# Altium schematic sheet Ext_Stepper_Driver_Sheet.SchDoc
size 420 x 297 mm; DocumentNumber: 8; SheetNumber: 8
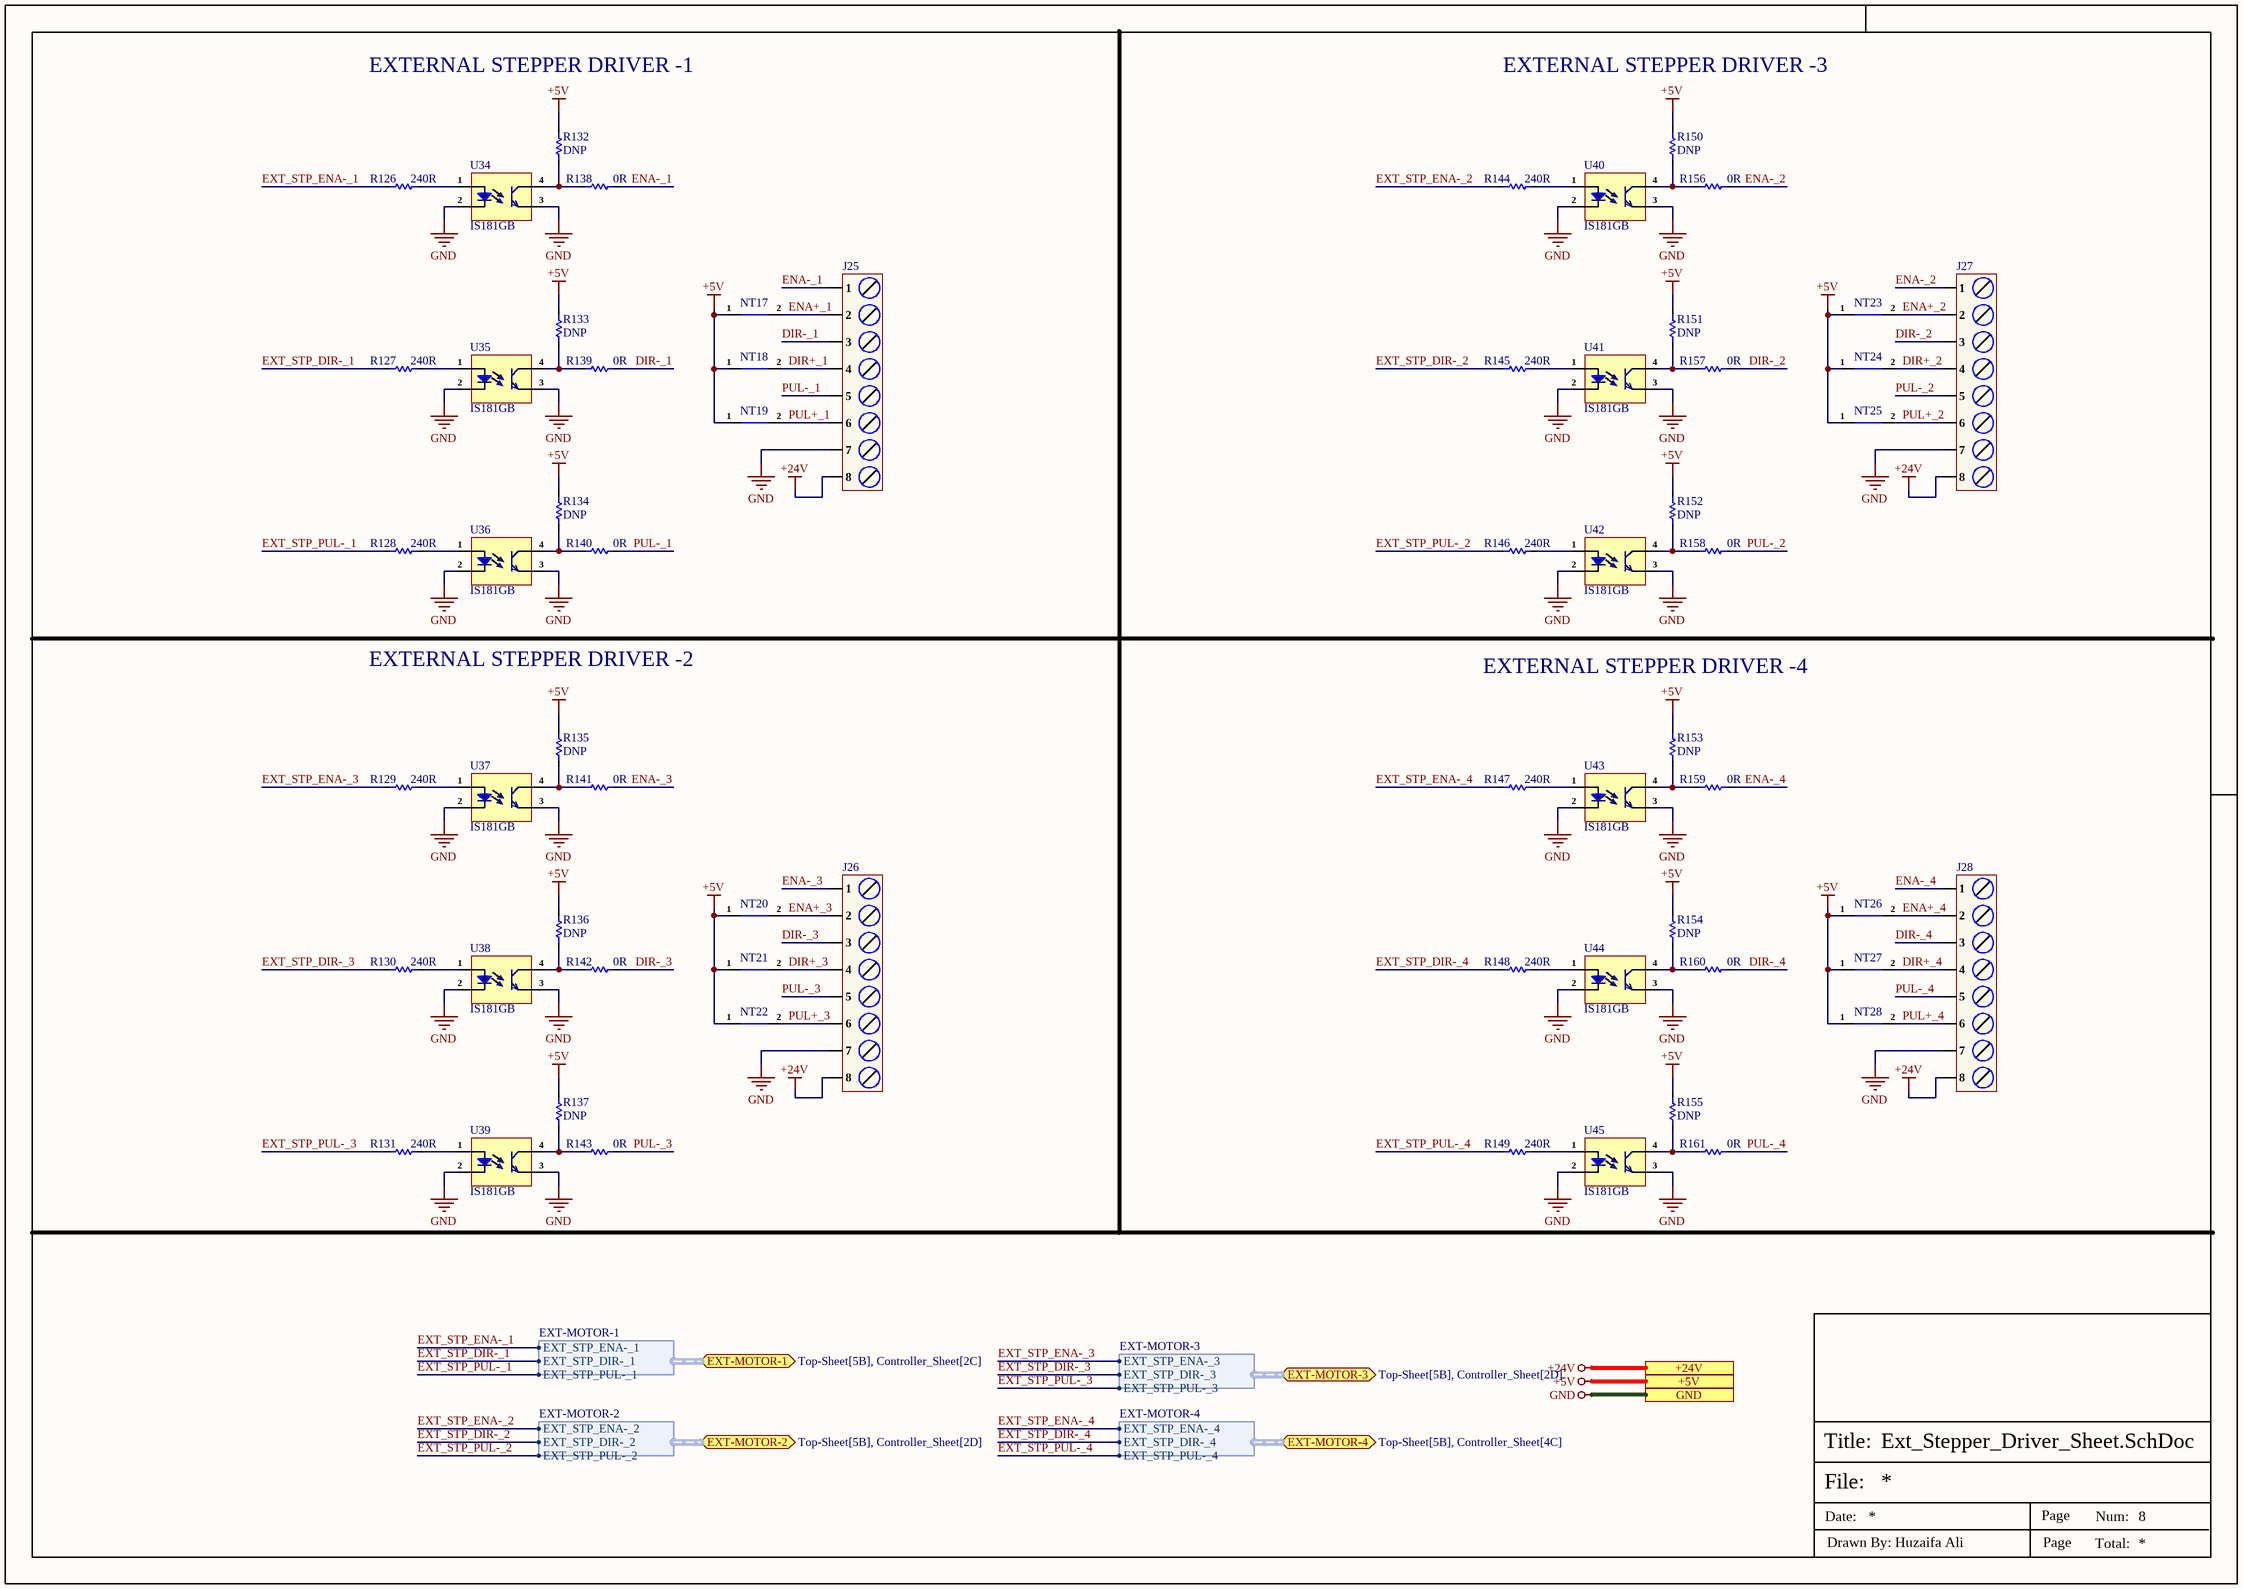
[diagram p0: Ext_Stepper_Driver_Sheet.SchDoc]

## Parts
J25  DB125-3.81-8P-GN-S  [DB125-3.81-8P-GN-S]  (value not drawn)
J26  DB125-3.81-8P-GN-S  [DB125-3.81-8P-GN-S]  (value not drawn)
J27  DB125-3.81-8P-GN-S  [DB125-3.81-8P-GN-S]  (value not drawn)
J28  DB125-3.81-8P-GN-S  [DB125-3.81-8P-GN-S]  (value not drawn)
NT17  Net Tie_SMD  [Net Tie Pad]  (value not drawn)  (net tie, no BOM)
NT18  Net Tie_SMD  [Net Tie Pad]  (value not drawn)  (net tie, no BOM)
NT19  Net Tie_SMD  [Net Tie Pad]  (value not drawn)  (net tie, no BOM)
NT20  Net Tie_SMD  [Net Tie Pad]  (value not drawn)  (net tie, no BOM)
NT21  Net Tie_SMD  [Net Tie Pad]  (value not drawn)  (net tie, no BOM)
NT22  Net Tie_SMD  [Net Tie Pad]  (value not drawn)  (net tie, no BOM)
NT23  Net Tie_SMD  [Net Tie Pad]  (value not drawn)  (net tie, no BOM)
NT24  Net Tie_SMD  [Net Tie Pad]  (value not drawn)  (net tie, no BOM)
NT25  Net Tie_SMD  [Net Tie Pad]  (value not drawn)  (net tie, no BOM)
NT26  Net Tie_SMD  [Net Tie Pad]  (value not drawn)  (net tie, no BOM)
NT27  Net Tie_SMD  [Net Tie Pad]  (value not drawn)  (net tie, no BOM)
NT28  Net Tie_SMD  [Net Tie Pad]  (value not drawn)  (net tie, no BOM)
R126  240R  [Res-0402]
R127  240R  [Res-0402]
R128  240R  [Res-0402]
R129  240R  [Res-0402]
R130  240R  [Res-0402]
R131  240R  [Res-0402]
R132  DNP  [Res-0402]
R133  DNP  [Res-0402]
R134  DNP  [Res-0402]
R135  DNP  [Res-0402]
R136  DNP  [Res-0402]
R137  DNP  [Res-0402]
R138  0R  [Res-0402]
R139  0R  [Res-0402]
R140  0R  [Res-0402]
R141  0R  [Res-0402]
R142  0R  [Res-0402]
R143  0R  [Res-0402]
R144  240R  [Res-0402]
R145  240R  [Res-0402]
R146  240R  [Res-0402]
R147  240R  [Res-0402]
R148  240R  [Res-0402]
R149  240R  [Res-0402]
R150  DNP  [Res-0402]
R151  DNP  [Res-0402]
R152  DNP  [Res-0402]
R153  DNP  [Res-0402]
R154  DNP  [Res-0402]
R155  DNP  [Res-0402]
R156  0R  [Res-0402]
R157  0R  [Res-0402]
R158  0R  [Res-0402]
R159  0R  [Res-0402]
R160  0R  [Res-0402]
R161  0R  [Res-0402]
U34  IS181GB  [SOP-4_2.54]
U35  IS181GB  [SOP-4_2.54]
U36  IS181GB  [SOP-4_2.54]
U37  IS181GB  [SOP-4_2.54]
U38  IS181GB  [SOP-4_2.54]
U39  IS181GB  [SOP-4_2.54]
U40  IS181GB  [SOP-4_2.54]
U41  IS181GB  [SOP-4_2.54]
U42  IS181GB  [SOP-4_2.54]
U43  IS181GB  [SOP-4_2.54]
U44  IS181GB  [SOP-4_2.54]
U45  IS181GB  [SOP-4_2.54]

## Ports
+5V (see Top-Sheet[5B], CAN_Sheet[5D], Controller_Sheet[5D], Power_Sheet[5D]), +24V (see Top-Sheet[5B], Power_Sheet[5D], Stepper_Driver_Sheet[5D]), EXT-MOTOR-1 (bidir, harness EXT-MOTOR-1, see Top-Sheet[5B], Controller_Sheet[2C]), EXT-MOTOR-2 (bidir, harness EXT-MOTOR-2, see Top-Sheet[5B], Controller_Sheet[2D]), EXT-MOTOR-3 (bidir, harness EXT-MOTOR-3, see Top-Sheet[5B], Controller_Sheet[2D]), EXT-MOTOR-4 (bidir, harness EXT-MOTOR-4, see Top-Sheet[5B], Controller_Sheet[4C]), GND (see Top-Sheet[5B], CAN_Sheet[5D], Controller_Sheet[5D], EtherCAT_Sheet[5D], Power_Sheet[5D], RS485_RS232_Sheet[2D], Stepper_Driver_Sheet[5D])

## Harnesses
EXT-MOTOR-1: EXT_STP_ENA-_1, EXT_STP_DIR-_1, EXT_STP_PUL-_1
EXT-MOTOR-2: EXT_STP_ENA-_2, EXT_STP_DIR-_2, EXT_STP_PUL-_2
EXT-MOTOR-3: EXT_STP_ENA-_3, EXT_STP_DIR-_3, EXT_STP_PUL-_3
EXT-MOTOR-4: EXT_STP_ENA-_4, EXT_STP_DIR-_4, EXT_STP_PUL-_4

## Nets
+5V: NT17.1 NT18.1 NT19.1 NT20.1 NT21.1 NT22.1 NT23.1 NT24.1 NT25.1 NT26.1 NT27.1 NT28.1 R132.2 R133.2 R134.2 R135.2 R136.2 R137.2 R150.2 R151.2 R152.2 R153.2 R154.2 R155.2 ; port +5V
+24V: J25.8 J26.8 J27.8 J28.8 ; port +24V
GND: J25.7 J26.7 J27.7 J28.7 U34.2(Ca) U34.3(E) U35.2(Ca) U35.3(E) U36.2(Ca) U36.3(E) U37.2(Ca) U37.3(E) U38.2(Ca) U38.3(E) U39.2(Ca) U39.3(E) U40.2(Ca) U40.3(E) U41.2(Ca) U41.3(E) U42.2(Ca) U42.3(E) U43.2(Ca) U43.3(E) U44.2(Ca) U44.3(E) U45.2(Ca) U45.3(E) ; port GND
DIR+_1: J25.4 NT18.2
DIR+_2: J27.4 NT24.2
DIR+_3: J26.4 NT21.2
DIR+_4: J28.4 NT27.2
DIR-_1: J25.3 R139.2
DIR-_2: J27.3 R157.2
DIR-_3: J26.3 R142.2
DIR-_4: J28.3 R160.2
ENA+_1: J25.2 NT17.2
ENA+_2: J27.2 NT23.2
ENA+_3: J26.2 NT20.2
ENA+_4: J28.2 NT26.2
ENA-_1: J25.1 R138.2
ENA-_2: J27.1 R156.2
ENA-_3: J26.1 R141.2
ENA-_4: J28.1 R159.2
EXT_STP_DIR-_1: R127.1 ; port EXT-MOTOR-1.EXT_STP_DIR-_1
EXT_STP_DIR-_2: R145.1 ; port EXT-MOTOR-2.EXT_STP_DIR-_2
EXT_STP_DIR-_3: R130.1 ; port EXT-MOTOR-3.EXT_STP_DIR-_3
EXT_STP_DIR-_4: R148.1 ; port EXT-MOTOR-4.EXT_STP_DIR-_4
EXT_STP_ENA-_1: R126.1 ; port EXT-MOTOR-1.EXT_STP_ENA-_1
EXT_STP_ENA-_2: R144.1 ; port EXT-MOTOR-2.EXT_STP_ENA-_2
EXT_STP_ENA-_3: R129.1 ; port EXT-MOTOR-3.EXT_STP_ENA-_3
EXT_STP_ENA-_4: R147.1 ; port EXT-MOTOR-4.EXT_STP_ENA-_4
EXT_STP_PUL-_1: R128.1 ; port EXT-MOTOR-1.EXT_STP_PUL-_1
EXT_STP_PUL-_2: R146.1 ; port EXT-MOTOR-2.EXT_STP_PUL-_2
EXT_STP_PUL-_3: R131.1 ; port EXT-MOTOR-3.EXT_STP_PUL-_3
EXT_STP_PUL-_4: R149.1 ; port EXT-MOTOR-4.EXT_STP_PUL-_4
PUL+_1: J25.6 NT19.2
PUL+_2: J27.6 NT25.2
PUL+_3: J26.6 NT22.2
PUL+_4: J28.6 NT28.2
PUL-_1: J25.5 R140.2
PUL-_2: J27.5 R158.2
PUL-_3: J26.5 R143.2
PUL-_4: J28.5 R161.2
NetR126_2: R126.2 U34.1(An)
NetR127_2: R127.2 U35.1(An)
NetR128_2: R128.2 U36.1(An)
NetR129_2: R129.2 U37.1(An)
NetR130_2: R130.2 U38.1(An)
NetR131_2: R131.2 U39.1(An)
NetR132_1: R132.1 R138.1 U34.4(C)
NetR133_1: R133.1 R139.1 U35.4(C)
NetR134_1: R134.1 R140.1 U36.4(C)
NetR135_1: R135.1 R141.1 U37.4(C)
NetR136_1: R136.1 R142.1 U38.4(C)
NetR137_1: R137.1 R143.1 U39.4(C)
NetR144_2: R144.2 U40.1(An)
NetR145_2: R145.2 U41.1(An)
NetR146_2: R146.2 U42.1(An)
NetR147_2: R147.2 U43.1(An)
NetR148_2: R148.2 U44.1(An)
NetR149_2: R149.2 U45.1(An)
NetR150_1: R150.1 R156.1 U40.4(C)
NetR151_1: R151.1 R157.1 U41.4(C)
NetR152_1: R152.1 R158.1 U42.4(C)
NetR153_1: R153.1 R159.1 U43.4(C)
NetR154_1: R154.1 R160.1 U44.4(C)
NetR155_1: R155.1 R161.1 U45.4(C)

## Notes on the sheet
- EXTERNAL STEPPER DRIVER -1
- EXTERNAL STEPPER DRIVER -3
- EXTERNAL STEPPER DRIVER -2
- EXTERNAL STEPPER DRIVER -4
- File:
- Title:
- Date:
- Page
- Num:
- Total:
- Drawn By: Huzaifa Ali

## Library data of the parts
J25-J28 = DB125-3.81-8P-GN-S: Plugin,P=3.81mm Screw Terminal Blocks ROHS; Manufacturer: DORABO; Manufacturer Part Number: DB125-3.81-8P-GN-S; Package: Plugin,P=3.81mm; LCSC Part Number: C5143698; Item Type: Terminal Block; ComponentLink1Description: LCSC; ComponentLink1URL: https://www.lcsc.com/product-detail/Screw-Terminal-Blocks_DORABO-DB125-3-81-8P-GN-S_C5143698.html
NT17-NT28 = Net Tie_SMD: Net Tie SMD; Manufacturer Part Number: Net Tie; Item Type: Net Tie Pad
R126-R131 R144-R149 = RC0402FR-07240RL: RES 240 OHM 1% 1/16W 0402; Manufacturer: Yageo; Item Type: Resistors; Power Rating: 63mW; Temperature Coefficient: 100ppm/°C; Voltage Rating (DC): 50V; Supplier 1: Mouser; Manufacturer Part Number: RC0402FR-07240RL; RoHS: Yes; Stock 1: 1903202; Pricing 1: 1=0.10000, 10=0.01200, 50=0.01200, 100=0.00500, 1000=0.00300, 10000=0.00100 (USD); Case/Package: 0402; Case Code (Metric): 1005; Case Code (Imperial): 0402; Size Code: 0402; Min Operating Temperature: -55°C; Max Operating Temperature: 155°C; Resistance: 240R; Tolerance: 1%; Packaging: Tape and Reel; Resistor Type: Thick Film; Voltage Rating: 50V; Package Quantity: 1; Number of Terminations: 2; Termination: SMD/SMT; Max Power Dissipation: 63mW; Features: Moisture Resistant; Series: RC; Construction: Rectangular; Resistance Tolerance: 1%; Length: 1mm; Width: 0.02inch; Height: 0.016inch; Depth: 0.5mm; REACH SVHC: Unknown; Lead Free: Lead Free; RoHS Compliant: Yes; Military Standard: Not; ComponentLink1URL: https://datasheet.ciiva.com/7849/1018594-7849915.pdf?src-supplier=Element14; ComponentLink1Description: https://datasheet.ciiva.com/7849/1018594-7849915.pdf?src-supplier=Element14; ComponentLink2URL: https://datasheet.ciiva.com/7849/1018594-7849916.pdf?src-supplier=Element14; ComponentLink2Description: https://datasheet.ciiva.com/7849/1018594-7849916.pdf?src-supplier=Element14; ComponentLink3URL: https://datasheet.ciiva.com/2519/pyu-r-int-thick-7-2519157.pdf?src-supplier=Digi-Key; ComponentLink3Description: https://datasheet.ciiva.com/2519/pyu-r-int-thick-7-2519157.pdf?src-supplier=Digi-Key; ComponentLink4URL: https://datasheet.ciiva.com/2519/pyu-r-int-thick-7-2519158.pdf?src-supplier=Digi-Key; ComponentLink4Description: https://datasheet.ciiva.com/2519/pyu-r-int-thick-7-2519158.pdf?src-supplier=Digi-Key; ComponentLink5URL: https://datasheet.ciiva.com/2519/pyu-r-int-thick-7-2519156.pdf?src-supplier=Digi-Key; ComponentLink5Description: https://datasheet.ciiva.com/2519/pyu-r-int-thick-7-2519156.pdf?src-supplier=Digi-Key; ComponentLink6URL: https://datasheet.ciiva.com/12669/pyu-rc0402-51-rohs-l-6-r-12669689.pdf?src-supplier=Mouser; ComponentLink6Description: https://datasheet.ciiva.com/12669/pyu-rc0402-51-rohs-l-6-r-12669689.pdf?src-supplier=Mouser; ComponentLink7URL: https://datasheet.ciiva.com/17419/pyu-rc0402-51-rohs-l-6-r-17419482.pdf?src-supplier=Future+Electronics; ComponentLink7Description: https://datasheet.ciiva.com/17419/pyu-rc0402-51-rohs-l-6-r-17419482.pdf?src-supplier=Future+Electronics; Supplier Part Number 1: 603-RC0402FR-07240RL; LCSC Part Number: C114755
R132-R137 R150-R155 = RC0402FR-0710KL: RES 10K OHM 1% 1/16W 0402; Manufacturer: Yageo; Resistance: 10kR; Voltage Rating (DC): 50V; Temperature Coefficient: 100ppm/°C; Power Rating: 62.5mW; Max Power Dissipation: 63mW; Item Type: Resistor; Supplier 1: Mouser; Manufacturer Part Number: RC0402FR-0710KL; RoHS: Yes; Category: Chip SMD Resistors; Stock 1: 18648329; Pricing 1: 1=0.10000, 10=0.01400, 50=0.01400, 100=0.00500, 1000=0.00300, 10000=0.00200 (USD); Case/Package: 0402; Number of Pins: 2; Case Code (Imperial): 0402; Case Code (Metric): 1005; Min Operating Temperature: -55°C; Max Operating Temperature: 155°C; Resistor Type: Thick Film; Tolerance: 1%; Packaging: Tape and Reel; Voltage Rating: 50V; Termination: SMD/SMT; Working Voltage: 50V; Number of Terminations: 2; Features: Moisture Resistant; Series: RC; Resistance Tolerance: 1%; Construction: Rectangular; Length: 1mm; Width: 0.5mm; Height: 0.32mm; Depth: 0.5mm; Lead Pitch: 0.2mm; REACH SVHC: No SVHC; Lead Free: Lead Free; RoHS Compliant: Yes; Military Standard: Not; ComponentLink1URL: https://datasheet.ciiva.com/7660/38568-7660787.pdf?src-supplier=Element14; ComponentLink1Description: https://datasheet.ciiva.com/7660/38568-7660787.pdf?src-supplier=Element14; ComponentLink2URL: https://datasheet.ciiva.com/7849/1686128-7849814.pdf?src-supplier=Element14; ComponentLink2Description: https://datasheet.ciiva.com/7849/1686128-7849814.pdf?src-supplier=Element14; ComponentLink3URL: https://datasheet.ciiva.com/7983/1018594-7983486.pdf?src-supplier=Element14; ComponentLink3Description: https://datasheet.ciiva.com/7983/1018594-7983486.pdf?src-supplier=Element14; ComponentLink4URL: https://datasheet.ciiva.com/22747/1018594-22747512.pdf?src-supplier=Element14; ComponentLink4Description: https://datasheet.ciiva.com/22747/1018594-22747512.pdf?src-supplier=Element14; ComponentLink5URL: https://datasheet.ciiva.com/12667/pyu-rc0402-51-rohs-l-6-r-12667067.pdf?src-supplier=Mouser; ComponentLink5Description: https://datasheet.ciiva.com/12667/pyu-rc0402-51-rohs-l-6-r-12667067.pdf?src-supplier=Mouser; ComponentLink6URL: https://datasheet.ciiva.com/7849/1784430-7849813.pdf?src-supplier=Element14; ComponentLink6Description: https://datasheet.ciiva.com/7849/1784430-7849813.pdf?src-supplier=Element14; ComponentLink7URL: https://datasheet.ciiva.com/7849/1784430-7849815.pdf?src-supplier=Element14; ComponentLink7Description: https://datasheet.ciiva.com/7849/1784430-7849815.pdf?src-supplier=Element14; Supplier Part Number 1: 603-RC0402FR-0710KL; LCSC Part Number: C60490
R138-R143 R156-R161 = RC0402FR-070RL: RES 0 OHM JUMPER 1/16W 0402; Manufacturer: Yageo; Item Type: Resistors; Tolerance: 1%; Power Rating: 62.5mW; Voltage Rating: 50V; Temperature Coefficient: 200ppm/°C; Max Power Dissipation: 63mW; Supplier 1: Mouser; Manufacturer Part Number: RC0402FR-070RL; RoHS: Yes; Stock 1: 8556842; Pricing 1: 1=0.10000, 10=0.01400, 50=0.01400, 100=0.00600, 1000=0.00300, 5000=0.00200, 10000=0.00100 (USD); Mount: Surface Mount; Case/Package: 0402; Contact Plating: Tin,Matte; Case Code (Imperial): 0402; Case Code (Metric): 1005; Size Code: 0402; Min Operating Temperature: -55°C; Max Operating Temperature: 155°C; Resistance: 0R; Resistor Type: Thick Film; Packaging: Tape and Reel; Termination: SMD/SMT; Features: Moisture Resistant; Series: RC; Number of Terminations: 2; Length: 1mm; Width: 0.5mm; Height: 0.35mm; Radiation Hardening: No; Lead Free: Lead Free; RoHS Compliant: Yes; ComponentLink1URL: https://datasheet.ciiva.com/8896/pyu-rc0402-51-rohs-l-6-8896149.pdf?src-supplier=Avnet; ComponentLink1Description: https://datasheet.ciiva.com/8896/pyu-rc0402-51-rohs-l-6-8896149.pdf?src-supplier=Avnet; ComponentLink2URL: https://datasheet.ciiva.com/16790/pyu-rc0402-51-rohs-l-6-r-16790444.pdf?src-supplier=Future+Electronics; ComponentLink2Description: https://datasheet.ciiva.com/16790/pyu-rc0402-51-rohs-l-6-r-16790444.pdf?src-supplier=Future+Electronics; Supplier Part Number 1: 603-RC0402FR-070RL; LCSC Part Number: C106231
U34-U45 = IS181GB: Optoisolator Transistor Output 3750Vrms 1 Channel; Manufacturer: Isocom; Forward Current: 50mA; Reverse Breakdown Voltage: 6V; Isolation Voltage: 3.75kV; Rise Time: 18000ns; Power Dissipation: 170mW; Number of Elements: 1; Collector Emitter Saturation Voltage: 200mV; Forward Voltage: 1.4V; Collector Emitter Voltage (VCEO): 80V; Current Transfer Ratio: 600%; Item Type: Optocoupler; Supplier 1: Arrow Electronics; Manufacturer Part Number: IS181GB; RoHS: Yes; Category: Optocouplers; Stock 1: 2922; Pricing 1: 1=0.55080, 10=0.34190, 25=0.33860, 50=0.33530, 100=0.19360, 250=0.19160, 500=0.18960, 1000=0.14750 (USD); Mount: Surface Mount; Case/Package: SMD/SMT; Number of Pins: 4; Min Operating Temperature: -55°C; Max Operating Temperature: 100°C; Fall Time: 18000ns; Radiation Hardening: No; Lead Free: Lead Free; RoHS Compliant: Yes; ComponentLink1URL: https://datasheet.ciiva.com/26895/getdatasheetpartid-624485-26895717.pdf?src-supplier=Verical; ComponentLink1Description: https://datasheet.ciiva.com/26895/getdatasheetpartid-624485-26895717.pdf?src-supplier=Verical; ComponentLink2URL: https://datasheet.ciiva.com/29301/183289-da-01-en-optokoppler-is181-gb-29301106.pdf?src-supplier=Conrad; ComponentLink2Description: https://datasheet.ciiva.com/29301/183289-da-01-en-optokoppler-is181-gb-29301106.pdf?src-supplier=Conrad; Supplier Part Number 1: IS181GB; LCSC Part Number: C84196